# Altium schematic sheet AP63203WU-7.schdoc
size 127 x 101 mm
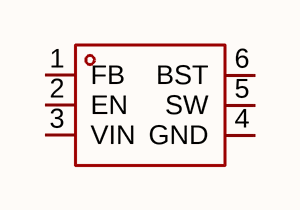
[diagram p0: AP63203WU-7.schdoc]

## Parts
U?  ap63203wu-7  [TSOT-26_L2.9-W1.6-P0.95-LS2.8-BL]  (value not drawn)

## Nets

Not connected (* = marked no-connect by the designer): U? 1(FB) 2(EN) 3(VIN) 4(GND) 5(SW) 6(BST)

## Library data of the parts
U? = ap63203wu-7: 功能类型:降压型;工作电压:3.8V~32V;输出电压:3.3V;输出电流:2A;输出类型:固定;; Manufacturer: DIODES(美台); AddInBom: yes; ModelId: 72111e290d4d478b9e0e0b94fc1a26b1; ModelTransform: 114.173,110.236,0,0,0,0,0,0,0; Function: 降压型; Output Voltage: 3.3V; Output Current: 2A; Frequency - Switching: 1.1MHz; Synchronous Rectifier: 是; Number of Outputs: 1; Topology: 降压式; Quiescent Current: 22uA; Switch tube (built-in/external): 内置; Output Type: 固定; Symbol: AP63203WU-7; LCSC Part Name: 降压型 2A 3.8V~32V; SupplierPart: C780769; ManufacturerPart: AP63203WU-7; Supplier Footprint: TSOT-23-6; JLCPCB Part Class: Extended Part; Datasheet: https://item.szlcsc.com/datasheet/AP63203WU-7/832852.html; Supplier: LCSC; ConvertToPcb: yes; FootprintName: TSOT-26_L2.9-W1.6-P0.95-LS2.8-BL; ModelName: TSOT-26_L2.9-W1.6-P0.95-LS2.8-BL; Voltage - Supply: 3.8V~32V; Operating Temperature: -40℃~+85℃@(TA); Features: 轻载高效模式；逐波限流；过流保护；EMI优化(抖频模式)；打嗝限流